# EasyEDA Pro project ProPrj_STM32_无人机_2026-10-21.epro, board PCB1
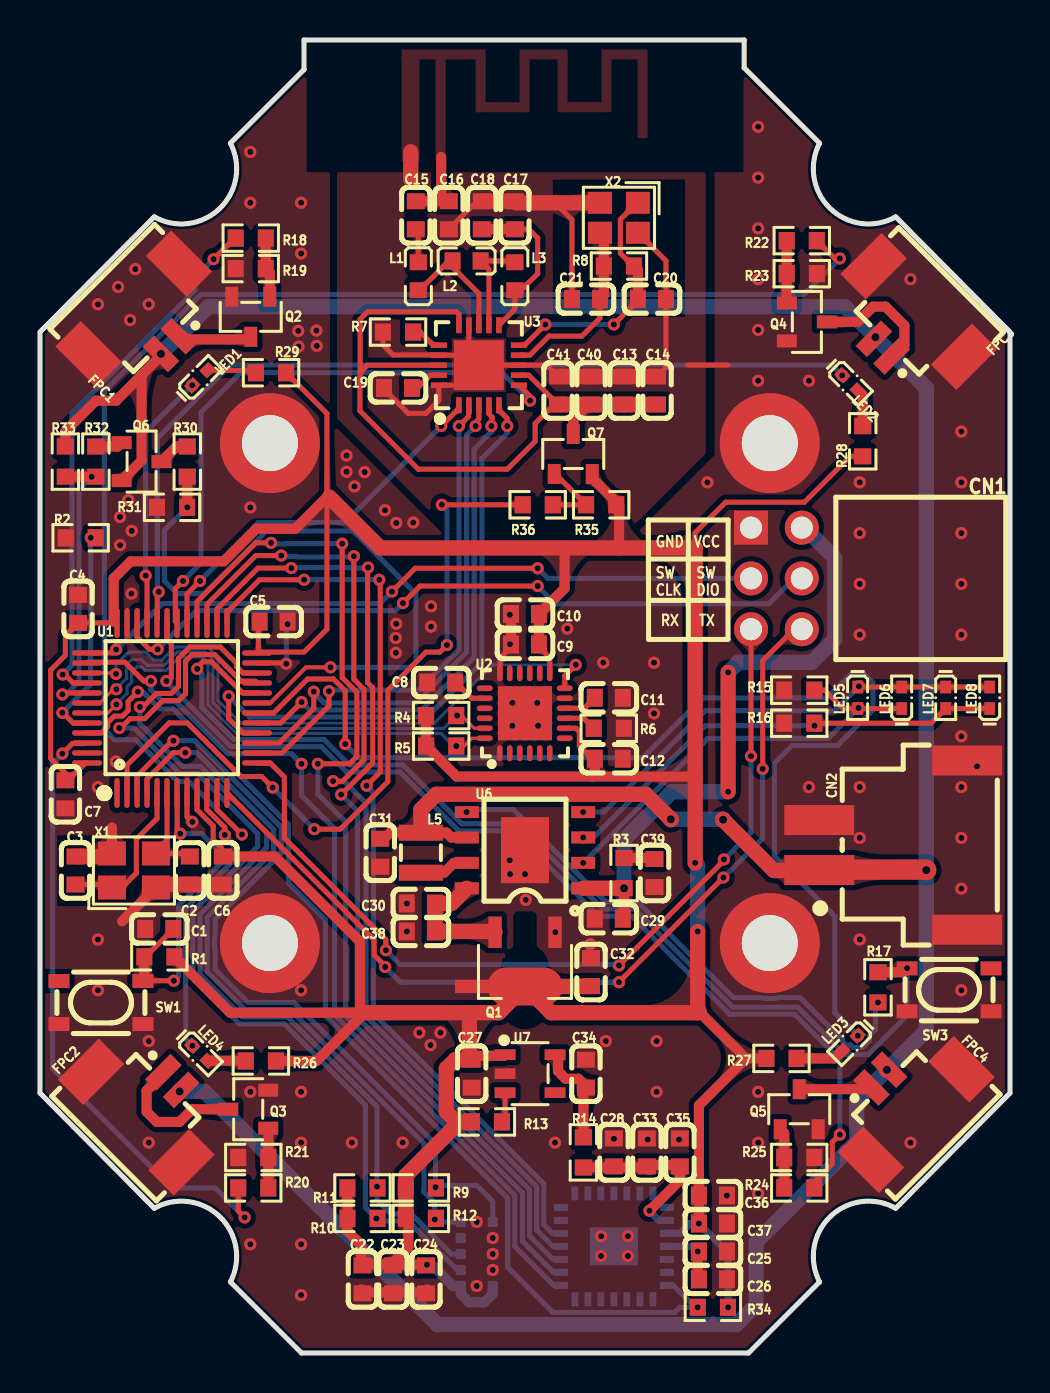
[diagram p12: board, top side]
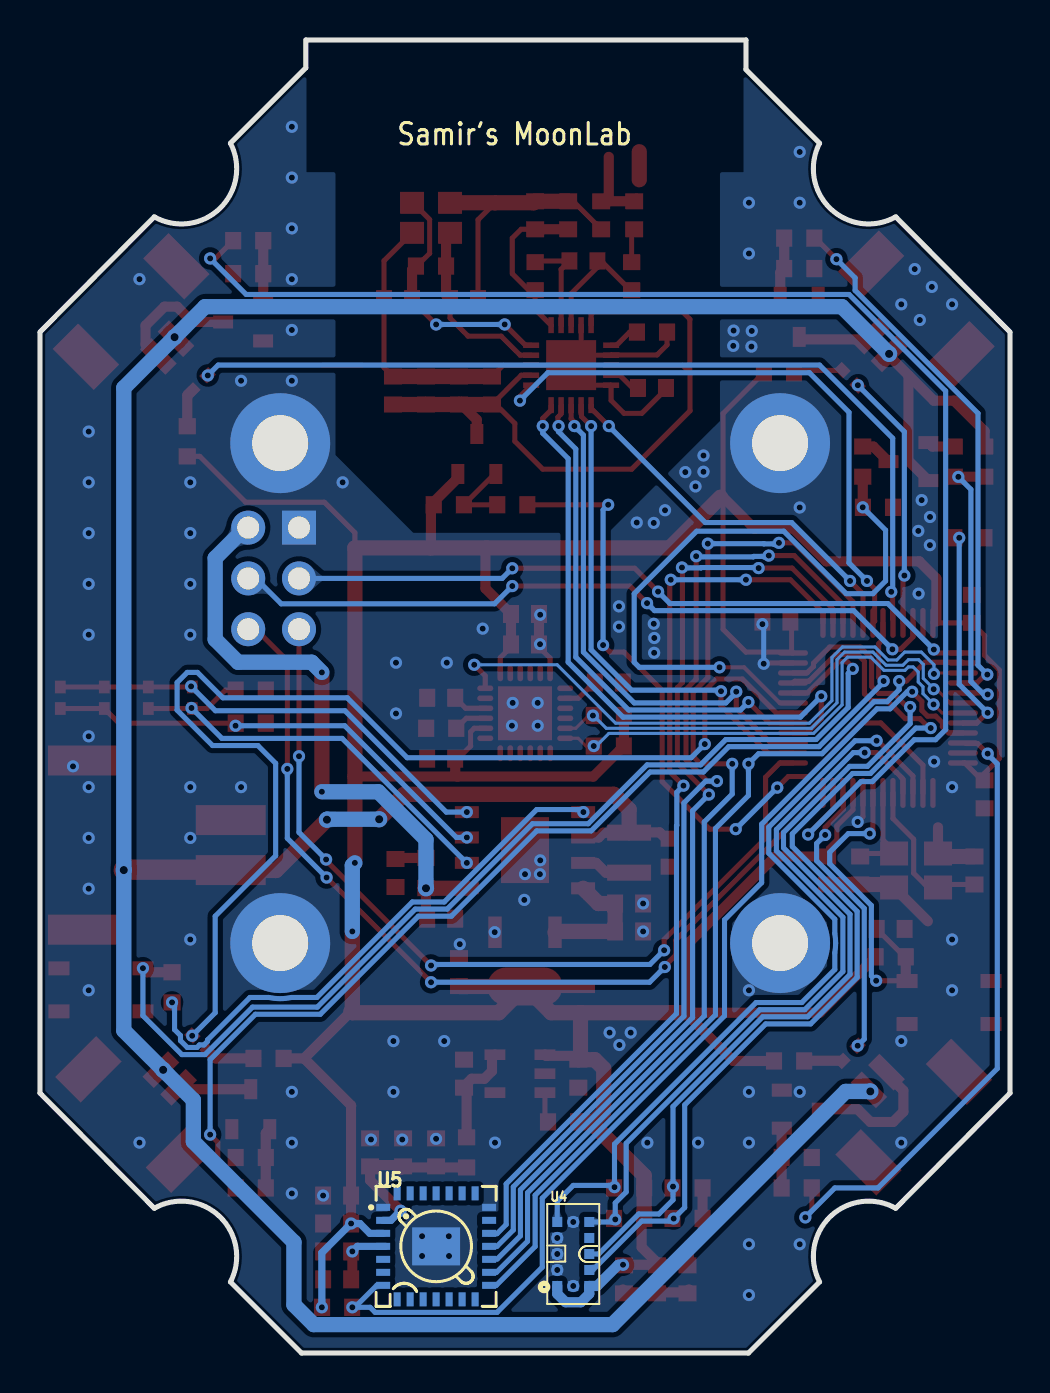
[diagram p13: board, bottom side, seen from below]

Outline 48.51 x 65.66 mm; copper layers: Top Layer, Bottom Layer. Coordinates in mm from the lower left corner of the outline.
Outline path: 0,51.05 5.72,56.81 arc(8.99,57.24) 9.53,60.5 13.21,64.18 13.21,65.66 35.22,65.66 35.22,64.27 38.99,60.5 arc(39.52,57.24) 42.8,56.81 48.51,51.05 ; 0,51 0,13 5.72,7.24 arc(8.99,6.82) 9.53,3.56 13.08,0 35.43,0 38.99,3.56 arc(39.52,6.82) 42.8,7.24 48.51,13 48.51,51
Stack: Top Layer 0.035mm / Dielectric1 1.51mm FR4 er 4.5 / Bottom Layer 0.035mm

## Design rules (mm)
spacing copperThickness1oz (default): track to track 0.102, other pairs 0.152 to 0.3
spacing copperThickness2oz: track to track 0.203, other pairs 0.152 to 0.3
track width copperThickness1oz (default): min 0.127, default 0.254, max 2.54
track width copperThickness2oz: min 0.203, default 0.254, max 2.54
differential pair differentialPair (default): width min 0.127, default 0.254, max 2.54; gap min 0.152, default 0.152
net GND uses copperRegion

## Placement (name value [footprint] x y rotation side)
C1  100nF  [C0603]  5.97 21.21 0 top
C2  12pF  [C0603]  7.49 24.13 90 top
C3  12pF  [C0603]  1.78 24.13 90 top
C4  100nF  [C0603]  1.91 37.21 270 top
C5  100nF  [C0603]  11.68 36.57 180 top
C6  100nF  [C0603]  9.14 24.13 90 top
C7  100nF  [C0603]  1.27 27.94 90 top
C8  2.2nF  [C0603]  20.07 33.53 180 top
C9  100nF  [C0603]  24.26 35.43 180 top
C10  2.2uF  [C0603]  24.26 36.96 180 top
C11  100nF  [C0603]  28.45 32.77 180 top
C12  10nF  [C0603]  28.45 29.72 0 top
C13  100nF  [C0603]  29.21 48.13 270 top
C14  10uF  [C0603]  30.86 48.13 270 top
C15  1.5pF  [C0603]  18.8 56.89 90 top
C16  1pF  [C0603]  20.45 56.89 90 top
C17  4.7pF  [C0603]  23.75 56.89 270 top
C18  2.2nF  [C0603]  22.1 56.89 270 top
C19  33nF  [C0603]  17.91 48.26 180 top
C20  22pF  [C0603]  30.61 52.7 0 top
C21  22pF  [C0603]  27.31 52.7 0 top
C22  4.7uF  [C0603]  16.13 3.68 90 top
C23  100nF  [C0603]  17.65 3.68 90 top
C24  1pF  [C0603]  19.3 3.68 90 top
C25  100nF  [C0603]  33.66 5.08 180 top
C26  4.7uF  [C0603]  33.66 3.68 180 top
C27  1uF  [C0603]  21.59 13.97 90 top
C28  22uF  [C0603]  28.7 10.03 90 top
C29  10uF  [C0603]  28.45 21.72 0 top
C30  10uF  [C0603]  19.05 22.48 180 top
C31  10uF  [C0603]  17.02 25.02 270 top
C32  10uF  [C0603]  27.56 19.05 90 top
C33  22uF  [C0603]  30.35 10.03 90 top
C34  1uF  [C0603]  27.31 13.97 270 top
C35  100nF  [C0603]  32 10.03 90 top
C36  10uF  [C0603]  33.66 7.87 0 top
C37  100nF  [C0603]  33.66 6.48 180 top
C38  22uF  [C0603]  19.05 21.08 0 top
C39  10uF  [C0603]  30.73 24 90 top
C40  10nF  [C0603]  27.56 48.13 270 top
C41  1nF  [C0603]  25.91 48.13 270 top
CN1  IPCP254F06PB28R  [HDR-TH_6P-P2.54-H-F-R2-C3-S2.54-1]  36.83 38.73 90 top
CN2  ZX-XH2.54-2PWT  [CONN-SMD_2P-P2.54_MEGASTAR_ZX-XH2.54-2PWT]  42.67 25.4 90 top
FPC1  1.25-2PWB  [CONN-SMD_2P-P1.25_DEALON_1.25-2PWB]  5.59 51.31 225 top
FPC2  1.25-2PWB  [CONN-SMD_2P-P1.25_DEALON_1.25-2PWB]  5.72 12.7 315 top
FPC3  1.25-2PWB  [CONN-SMD_2P-P1.25_DEALON_1.25-2PWB]  43.05 51.18 135 top
FPC4  1.25-2PWB  [CONN-SMD_2P-P1.25_DEALON_1.25-2PWB]  42.93 12.83 45 top
L1  3.9nH  [L0603]  18.92 53.85 90 top
L2  8.2nH  [L0603]  21.34 54.61 180 top
L3  2.7nH  [L0603]  23.75 53.85 90 top
L5  2.2uH  [IND-SMD_L2.5-W2.0_MHCHL2520]  19.05 25.02 90 top
LED1  XL-1005UYC  [LED0402-FD_YELLOW]  8 48.77 225 top
LED2  XL-1005UYC  [LED0402-FD_YELLOW]  40.51 48.51 135 top
LED3  XL-1005UYC  [LED0402-FD_YELLOW]  40.51 15.49 45 top
LED4  XL-1005UYC  [LED0402-FD_YELLOW]  8 14.98 135 top
LED5  XL-1005UYC  [LED0402-FD_YELLOW]  40.89 32.77 90 top
LED6  XL-1005UYC  [LED0402-FD_YELLOW]  43.1 32.77 270 top
LED7  XL-1005UYC  [LED0402-FD_YELLOW]  45.3 32.77 90 top
LED8  XL-1005UYC  [LED0402-FD_YELLOW]  47.5 32.77 270 top
NOREF  -  [Pad_e325]  11.5 20.5 0 top
NOREF#2  -  [Pad_e976]  18.54 59.69 90 top
NOREF#3  -  [Pad_e977]  20.03 59.69 90 top
NOREF#4  -  [Pad_e328]  36.5 20.5 0 top
NOREF#5  -  [Pad_e327]  36.5 45.5 0 top
NOREF#6  -  [Pad_e326]  11.5 45.5 0 top
Q1  AMS1117-3.3V  [SOT-89-3_L4.5-W2.5-P1.50-LS4.2-BR]  24.26 19.68 90 top
Q2  AO3400A  [SOT-23-3_L2.9-W1.3-P1.90-LS2.4-BR]  10.54 51.81 90 top
Q3  AO3400A  [SOT-23-3_L2.9-W1.3-P1.90-LS2.4-BR]  10.41 12.19 0 top
Q4  AO3400A  [SOT-23-3_L2.9-W1.3-P1.90-LS2.4-BR]  38.35 51.56 180 top
Q5  AO3400A  [SOT-23-3_L2.9-W1.3-P1.90-LS2.4-BR]  37.97 12.19 270 top
Q6  SI2301A  [SOT-23-3_L2.9-W1.3-P1.90-LS2.4-BR]  5.08 44.58 180 top
Q7  SI2301A  [SOT-23-3_L2.9-W1.3-P1.90-LS2.4-BR]  26.67 44.96 270 top
R1  10KΩ  [R0603]  5.97 19.81 0 top
R2  10KΩ  [R0603]  2.03 40.77 180 top
R3  2Ω  [R0603]  29.21 24 90 top
R4  10KΩ  [R0603]  20.07 31.88 180 top
R5  10KΩ  [R0603]  20.07 30.35 180 top
R6  10KΩ  [R0603]  28.45 31.24 180 top
R7  22KΩ  [R0603]  17.91 51.05 180 top
R8  1MΩ  [R0603]  28.96 54.35 180 top
R9  10K  [R0603]  19.05 8.25 0 top
R10  10K  [R0603]  16.13 6.73 0 top
R11  10K  [R0603]  16.13 8.25 0 top
R12  10K  [R0603]  19.05 6.73 0 top
R13  1KΩ  [R0603]  22.35 11.56 0 top
R14  3Ω  [R0603]  27.18 10.03 270 top
R15  100KΩ  [R0603]  37.97 33.15 0 top
R16  100KΩ  [R0603]  37.97 31.49 0 top
R17  10KΩ  [R0603]  41.91 18.29 90 top
R18  1KΩ  [R0603]  10.54 55.75 0 top
R19  10KΩ  [R0603]  10.54 54.23 0 top
R20  1KΩ  [R0603]  10.67 8.25 0 top
R21  10KΩ  [R0603]  10.67 9.78 0 top
R22  1KΩ  [R0603]  38.1 55.62 180 top
R23  10KΩ  [R0603]  38.1 53.97 180 top
R24  1KΩ  [R0603]  37.97 8.25 180 top
R25  10KΩ  [R0603]  37.97 9.78 180 top
R26  10K  [R0603]  11.05 14.6 0 top
R27  10K  [R0603]  37.08 14.73 180 top
R28  10K  [R0603]  41.15 45.59 270 top
R29  10K  [R0603]  11.56 49.02 0 top
R30  100KΩ  [R0603]  7.37 44.58 90 top
R31  100KΩ  [R0603]  6.6 42.29 0 top
R32  1KΩ  [R0603]  2.79 44.58 270 top
R33  100KΩ  [R0603]  1.27 44.58 270 top
R34  10K  [R0603]  33.66 2.28 180 top
R35  10K  [R0603]  28.07 42.42 0 top
R36  1K  [R0603]  24.89 42.42 0 top
SW1  SKRPACE010  [KEY-SMD_4P-L4.2-W3.2-P2.20-LS4.6]  3.05 17.52 0 top
SW3  SKRPACE010  [KEY-SMD_4P-L4.2-W3.2-P2.20-LS4.6]  45.47 18.16 0 top
U1  STM32F103C8T6  [LQFP-48_L7.0-W7.0-P0.50-LS9.0-BL]  6.6 32.26 0 top
U2  MPU-6050  [QFN-24_L4.0-W4.0-P0.50-BL-EP2.7]  24.24 31.99 0 top
U3  Si24R1  [QFN-20_L4.0-W4.0-P0.50-BL-EP]  21.95 49.4 0 top
U4  VL53L1CXV0FY/1  [OPTO-SMD_VL53L1CXV0FY-1]  21.84 4.95 270 bottom
U5  PMW3901MB-TXQT  [COB-28_L6.0-W6.0-P0.65-TL-EP]  28.7 5.33 180 bottom
U6  IP5305T  [ESOP-8_L4.9-W3.9-P1.27-LS6.0-BL-EP]  24.26 25.14 90 top
U7  XC6204B182MR  [SOT-23-5_L3.0-W1.5-P0.95-LS2.8-BL]  24.51 13.97 270 top
X1  8MHz  [CRYSTAL-SMD_4P-L3.2-W2.5-BL]  4.7 24.13 0 top
X2  16MHz  [CRYSTAL-SMD_4P-L2.5-W2.0-BL-2]  28.96 56.77 180 top

## Footprints (pads in the part's own frame, mm; a bottom-side part is the same pattern mirrored in y, then rotated)
C0603
  rect 0.8x0.9 smd: 1(-0.7,0) 2(0.7,0)
COB-28_L6.0-W6.0-P0.65-TL-EP
  rect 0.7x0.35 smd: 1(-2.65,1.95) 2(-2.65,1.3) 3(-2.65,0.65) 4(-2.65,0) 5(-2.65,-0.65) 6(-2.65,-1.3) 7(-2.65,-1.95) 15(2.65,-1.95) 16(2.65,-1.3) 17(2.65,-0.65) 18(2.65,0) 19(2.65,0.65) 20(2.65,1.3) 21(2.65,1.95)
  rect 0.35x0.7 smd: 8(-1.95,-2.65) 9(-1.3,-2.65) 10(-0.65,-2.65) 11(0,-2.65) 12(0.65,-2.65) 13(1.3,-2.65) 14(1.95,-2.65) 22(1.95,2.65) 23(1.3,2.65) 24(0.65,2.65) 25(0,2.65) 26(-0.65,2.65) 27(-1.3,2.65) 28(-1.95,2.65)
  rect 2.4x1.9 smd: 29(0,0)
CONN-SMD_2P-P1.25_DEALON_1.25-2PWB
  rect 0.8x1.8 smd: 1(-0.625,1.275) 2(0.625,1.275)
  rect 1.8x2.9 smd: 3(-3.2,-1.275) 4(3.2,-1.275)
CONN-SMD_2P-P2.54_MEGASTAR_ZX-XH2.54-2PWT
  rect 1.5x3.5 smd: 1(-1.25,3.7) 2(1.25,3.7) 3(-4.23,-3.7) 4(4.23,-3.7)
CRYSTAL-SMD_4P-L2.5-W2.0-BL-2
  rect 1.2x1.1 smd: 1(-0.95,-0.75) 2(0.95,-0.75) 3(0.95,0.75) 4(-0.95,0.75)
CRYSTAL-SMD_4P-L3.2-W2.5-BL
  rect 1.4x1.2 smd: 1(-1.1,-0.85) 2(1.1,-0.85) 3(1.1,0.85) 4(-1.1,0.85)
ESOP-8_L4.9-W3.9-P1.27-LS6.0-BL-EP
  rect 0.6x1.2 smd: 1(-1.905,-2.909) 2(-0.635,-2.909) 3(0.635,-2.909) 4(1.905,-2.909) 5(1.905,2.909) 6(0.635,2.909) 7(-0.635,2.909) 8(-1.905,2.909)
  rect 3.3x2.4 smd: 9(0,0)
HDR-TH_6P-P2.54-H-F-R2-C3-S2.54-1
  rect 1.7x1.7 hole 1.1: 1(2.54,1.27)
  round 1.7 hole 1.1: 2(2.54,-1.27) 3(0,1.27) 4(0,-1.27) 5(-2.54,1.27) 6(-2.54,-1.27)
IND-SMD_L2.5-W2.0_MHCHL2520
  rect 0.8x2.2 smd: 1(-1,0) 2(1,0)
KEY-SMD_4P-L4.2-W3.2-P2.20-LS4.6
  rect 1.05x0.7 smd: 1(-2.1,1.075) 2(2.1,1.075) 3(-2.1,-1.075) 4(2.1,-1.075)
L0603
  rect 0.8x0.864 smd: 1(-0.7,0) 2(0.7,0)
LED0402-FD_YELLOW
  rect 0.636x0.54 smd: 1(-0.538,0) 2(0.538,0)
LQFP-48_L7.0-W7.0-P0.50-LS9.0-BL
  oval 0.27x1.5 smd: 1(-2.75,-4.25) 2(-2.25,-4.25) 3(-1.75,-4.25) 4(-1.25,-4.25) 5(-0.75,-4.25) 6(-0.25,-4.25) 7(0.25,-4.25) 8(0.75,-4.25) 9(1.25,-4.25) 10(1.75,-4.25) 11(2.25,-4.25) 12(2.75,-4.25) 25(2.75,4.25) 26(2.25,4.25) 27(1.75,4.25) 28(1.25,4.25) 29(0.75,4.25) 30(0.25,4.25) 31(-0.25,4.25) 32(-0.75,4.25) 33(-1.25,4.25) 34(-1.75,4.25) 35(-2.25,4.25) 36(-2.75,4.25)
  oval 1.5x0.27 smd: 13(4.25,-2.75) 14(4.25,-2.25) 15(4.25,-1.75) 16(4.25,-1.25) 17(4.25,-0.75) 18(4.25,-0.25) 19(4.25,0.25) 20(4.25,0.75) 21(4.25,1.25) 22(4.25,1.75) 23(4.25,2.25) 24(4.25,2.75) 37(-4.25,2.75) 38(-4.25,2.25) 39(-4.25,1.75) 40(-4.25,1.25) 41(-4.25,0.75) 42(-4.25,0.25) 43(-4.25,-0.25) 44(-4.25,-0.75) 45(-4.25,-1.25) 46(-4.25,-1.75) 47(-4.25,-2.25) 48(-4.25,-2.75)
OPTO-SMD_VL53L1CXV0FY-1
  rect 0.5x0.5 smd: 1(1.6,-0.8) 2(0.8,-0.8) 3(0,-0.8) 4(-0.8,-0.8) 5(-1.6,-0.8) 6(-1.6,0) 7(-1.6,0.8) 8(-0.8,0.8) 9(0,0.8) 10(0.8,0.8) 11(1.6,0.8) 12(1.6,0)
Pad_e325
  round 5 hole 2.8: 1(0,0)
Pad_e326
  round 5 hole 2.8: 1(0,0)
Pad_e327
  round 5 hole 2.8: 1(0,0)
Pad_e328
  round 5 hole 2.8: 1(0,0)
Pad_e976
  rect 0.2x0.2 smd: 2(0,0)
Pad_e977
  rect 0.2x0.2 smd: 1(0,0)
QFN-20_L4.0-W4.0-P0.50-BL-EP
  rect 0.28x0.8 smd: 1(-1,-2) 2(-0.5,-2) 3(0,-2) 4(0.5,-2) 5(1,-2) 11(1,2) 12(0.5,2) 13(0,2) 14(-0.5,2) 15(-1,2)
  rect 0.8x0.28 smd: 6(2,-1) 7(2,-0.5) 8(2,0) 9(2,0.5) 10(2,1) 16(-2,1) 17(-2,0.5) 18(-2,0) 19(-2,-0.5) 20(-2,-1)
  rect 2.5x2.5 smd: 21(0,0)
QFN-24_L4.0-W4.0-P0.50-BL-EP2.7
  oval 0.28x0.8 smd: 1(-1.25,-2) 2(-0.75,-2) 3(-0.25,-2) 4(0.25,-2) 5(0.75,-2) 6(1.25,-2) 13(1.25,2) 14(0.75,2) 15(0.25,2) 16(-0.25,2) 17(-0.75,2) 18(-1.242,2)
  oval 0.8x0.28 smd: 7(2,-1.25) 8(2,-0.75) 9(2,-0.25) 10(2,0.25) 11(2,0.75) 12(2,1.25) 19(-2,1.25) 20(-2,0.75) 21(-2,0.25) 22(-2,-0.25) 23(-2,-0.75) 24(-2,-1.25)
  rect 2.7x2.7 smd: 25(0.013,0)
R0603
  rect 0.806x0.864 smd: 1(-0.753,0) 2(0.753,0)
SOT-23-3_L2.9-W1.3-P1.90-LS2.4-BR
  rect 1x0.65 smd: 1(1,-0.95) 2(1,0.95) 3(-1,0)
SOT-23-5_L3.0-W1.5-P0.95-LS2.8-BL
  rect 0.532x1.045 smd: 1(-0.95,-1.25) 2(0,-1.25) 3(0.95,-1.25) 4(0.95,1.25) 5(-0.95,1.25)
SOT-89-3_L4.5-W2.5-P1.50-LS4.2-BR
  rect 1.575x0.672 smd: 1(1.356,-1.5) 3(1.356,1.5)
  custom 1.9x5.377 smd: 2(-1.356,0)

## Nets
As in the schematic, except:
GND: C1.1 C2.1 C3.2 C4.1 C5.1 C6.1 C7.1 C8.2 C9.2 C10.2 C11.1 C12.2 C13.1 C14.1 C16.1 C17.1 C18.1 C19.2 C20.2 C21.1 C22.1 C23.1 C24.1 C25.1 C26.1 C27.1 C28.2 C29.1 C30.2 C31.2 C32.2 C33.2 C34.1 C35.2 C36.2 C37.1 C38.1 C39.1 C40.1 C41.1 CN1.1 CN2.2 CN2.3 CN2.4 FPC1.3 FPC1.4 FPC2.3 FPC2.4 FPC3.3 FPC3.4 FPC4.3 FPC4.4 NOREF.1 NOREF#2.2 NOREF#4.1 NOREF#5.1 NOREF#6.1 Q1.1 Q2.2 Q3.2 Q4.2 Q5.2 R2.2 R6.1 R7.2 R15.1 R16.1 R19.1 R21.1 R23.1 R25.1 R31.1 SW1.3 SW1.4 SW3.3 SW3.4 U1.8 U1.23 U1.35 U1.47 U2.1 U2.11 U2.18 U2.25 U3.8 U3.14 U3.17 U3.20 U3.21 U4.2 U4.3 U4.4 U4.6 U4.12 U5.1 U5.21 U5.29 U6.9 U7.2 X1.2 X1.4 X2.2 X2.4
AT1: C15.2 C16.2 NOREF#3.1

Pads without a net: SW1 1; SW3 2; U1 1; U2 2 3 4 5 6 7 14 15 16 17 19 21 22; U4 8; U5 5 6 8 9 10 11 12 13 14 20 22 23 24 25 26 27 28; U7 4

## Via types
v1: diameter 0.61, hole 0.305, Top Layer to Bottom Layer, 224 vias
v2: diameter 0.813, hole 0.406, Top Layer to Bottom Layer, 8 vias

## Routing (per net, layer and track width the routed paths; a pad name or vN(x,y) marks a point on that pad's centre or on a via; arc(x,y) is an arc through that point)
1V8: length 5.2
  Top Layer w0.508: U7.5 25.91,14.77 25.91,14.1 26.29,13.71 26.92,13.71 27.31,13.33 C34.2 27.18,13.14 R14.1
3V3: length 233.1
  Top Layer w0.254: 10.92,35.05 13.21,35.05 14.35,36.19 14.35,42.67 ; 10.92,35.05 10.92,36.51 ; 10.92,35.05 10.88,35.01 U1.24 ; U1.36 3.75,36.51 3.75,36.51 C4.2 1.27,35.88 1.27,34.89 0.53,34.15 0.53,29.73 1.27,28.99 C7.2 ; 9.08,24.83 9.08,25.25 8.66,25.66 8.66,26.36 7.85,27.17 U1.9 ; 1.33,28.58 2.27,29.51 U1.48 ; 24.96,35.3 25.49,34.77 U2.13 ; 14.35,42.8 14.35,46.98 R29.2 ; C12.1 27.61,29.72 26.98,30.35 26.98,31.06 26.8,31.24 U2.8 ; R28.2 40.52,44.84 38.23,42.54 34.29,42.54 32.77,41.02 32.77,40.26
  Top Layer w0.508: 17.71,4.58 17.58,4.44 16.06,4.44 16.06,5.41 15.37,6.1 15.37,6.61 ; 17.71,4.58 18.42,5.29 18.42,7.11 ; 17.71,4.58 17.88,4.41 v1(19.35,4.41) ; 24.96,35.3 C10.1 26.24,38.23 26.24,40.2 26.18,40.26 ; R11.1 R10.1 ; C12.1 27.75,28.95 27.62,28.83 ; v1(32.96,6.48) C36.1 32.96,12.38 35.31,14.73 ; 28.96,40.26 28.96,42.4 28.83,42.4 R35.2 28.89,42.48 27.62,43.75 Q7.2 ; 35.31,14.73 R27.2 ; 35.31,14.73 32.96,17.08 ; 3.68,36.57 3.68,38.73 4.54,39.59 9.19,39.59 10.82,41.22 12.78,41.22 14.35,42.8 14.35,42.67 14.48,42.8 ; C27.2 21.78,14.86 23.2,14.86 U7.1 ; 27.62,28.83 20.84,28.83 R5.2 R4.2 ; 27.62,28.83 32.77,28.83 ; C6.2 11.75,24.83 16,20.57 16,17.28 16.26,17.03 ; R26.2 13.83,14.6 16.25,17.02 9.52,17.02 R1.2
  Top Layer w0.762: 21.48,17.02 22.95,17.02 24.26,18.33 ; 21.48,17.02 21.48,14.78 C27.2 20.77,14.67 20.32,14.22 20.32,12.06 20.83,11.56 20.98,11.56 ; 21.48,17.02 16.25,17.02 ; 14.48,42.8 17.02,40.26 32.77,40.26 v1(32.77,24.51) ; v1(32.89,21.08) 32.89,17.14 32.96,17.08 32.89,17.02 25.57,17.02 24.26,18.33 ; 20.98,11.56 18.3,8.87 R9.1 18.3,7.11 ; 20.98,11.56 R13.1 ; C32.1 27.54,18.33 24.26,18.33
  Bottom Layer w0.355: U5.3 32.02,5.98 32.51,6.48 v1(32.96,6.48) 34.42,5.01 v1(34.42,2.28)
  Bottom Layer w0.508: U4.1 22.64,2.96 22.22,2.54 21.46,2.54 21.04,2.96 U4.11 20.65,3.35 19.59,4.41 v1(19.35,4.41)
  Bottom Layer w0.762: v1(32.77,24.51) 32.89,24.38 v1(32.89,21.08)
+5V: length 6.3
  Top Layer w0.762: Q1.3 22.72,21.08 C38.2 C30.1 20.59,22.48 U6.8
GND: length 67.4
  Top Layer w0.254: U1.23 12.29,34.51 12.32,34.48 ; 32.38,49.4 34.42,49.4 ; X2.4 31.31,54.62 C20.2 31.31,49.28 C14.1 ; R7.2 17.15,50.41 17.65,49.91 19.94,49.91 U3.17 21.45,49.9 U3.14 ; 25.75,57.52 26.6,56.67 26.6,52.7 ; C41.1 25.34,49.4 U3.8 U3.21 20.95,48.4 U3.20 19.95,47.64 19.3,46.99 18.41,46.99 17.21,48.2 C19.2 ; 23.56,35.3 23,34.75 U2.18 ; C5.1 12.32,36.51 12.32,36.45 ; C16.1 21.85,57.59 ; v1(7.62,26.56) 7.35,26.82 U1.8
  Top Layer w0.508: 19.36,3.18 19.21,3.03 16.21,3.03 16.06,3.18 ; 5.8,23.28 4.11,21.59 ; X1.4 3.6,26.29 ; 23.56,36.96 23.56,35.3
  Top Layer w0.762: C41.1 C40.1 C13.1 C14.1 ; C6.1 C2.1 5.95,23.43 5.8,23.28 ; X2.2 23.83,57.52 C17.1 C18.1 ; C3.2 3.07,24.83 3.22,24.98 ; 18.54,58.67 18.54,60.07
  Bottom Layer w0.254: 12.32,34.48 12.32,36.45
  vias: v1(2.9,52.44) v1(2.9,28.3) v1(2.9,20.68) v1(2.9,18.14) v1(3.8,29.57) v1(3.91,53.31) v1(4,41.81) v1(4.01,40.4) v1(4.42,42.65) v1(4.51,51.66) v1(4.59,41.11) v1(4.57,37.97) v1(4.77,54.2) v1(5.44,52.44) v1(5.44,15.6) v1(5.44,10.52) v1(10.52,60.06) v1(10.52,57.52) v1(10.52,42.28) v1(10.52,13.06) v1(10.52,5.44) v1(12.32,34.47) v1(12.38,36.45) v1(12.91,51.11) v1(12.93,50.33) v1(13.06,57.52) v1(13.06,54.98) v1(13.06,18.14) v1(13.06,13.06) v1(13.06,10.52) v1(13.06,5.44) v1(13.06,2.9) v1(13.82,51.13) v1(13.84,50.36) v1(15.33,44.88) v1(15.33,44.07) v1(15.6,10.52) v1(15.73,43.33) v1(16.24,44.05) v1(17.25,42.14) v1(17.82,41.51) v1(17.82,36.47) v1(17.79,35.76) v1(17.8,35.01) v1(18.14,10.52) v1(18.35,22.48) v1(18.35,21.08) v1(18.67,41.53) v1(18.97,16.02) v1(19.54,15.4) v1(19.56,37.34) v1(19.56,36.32) v1(20.03,16.02) v1(21.84,6.55) v1(21.84,3.35) v1(22.64,5.75) v1(22.64,4.95) v1(22.64,4.15) v1(23.5,36.92) v1(23.51,35.44) v1(23.5,24.64) v1(23.51,23.94) v1(23.62,32.51) v1(23.62,31.37) v1(24.26,23.94) v1(24.29,22.66) v1(24.87,32.51) v1(24.91,31.37) v1(25.77,21.05) v1(25.76,10.52) v1(26.37,36.22) v1(27.52,20.44) v1(28.07,5.84) v1(28.06,4.85) v1(28.17,34.52) v1(28.3,15.6) v1(28.7,10.71) v1(29.41,5.84) v1(29.41,4.85) v1(30.4,10.68) v1(30.71,34.52) v1(30.71,31.98) v1(30.84,15.6) v1(30.84,13.06) v1(31.96,10.68) v1(33.38,43.54) v1(34.35,7.87) v1(35.92,61.32) v1(35.92,58.78) v1(35.92,56.24) v1(35.92,53.7) v1(35.92,51.16) v1(35.92,48.62) v1(35.92,13.06) v1(35.92,10.52) v1(35.92,7.98) v1(38.46,48.62) v1(38.46,28.3) v1(41,43.54) v1(41,41) v1(41,38.46) v1(41,35.92) v1(41,28.3) v1(41,25.76) v1(41,20.68) v1(43.54,53.7) v1(43.54,10.52) v1(46.08,46.08) v1(46.08,43.54) v1(46.08,41) v1(46.08,38.46) v1(46.08,35.92) v1(46.08,30.84) v1(46.08,28.3) v1(46.08,25.76) v1(46.08,23.22) v1(46.08,18.14) v1(46.86,29.34)
VBAT: length 170.2
  Top Layer w0.508: C31.1 17.21,25.72 17.53,26.03 19.03,26.03 L5.2 20.34,26.02 20.57,25.78 U6.6 ; Q6.2 5.08,44.63 5.08,48.89 ; R33.1 1.27,46.1 2.79,47.62 3.81,47.62 5.08,48.89 ; v2(6.05,49.96) 6.05,49.86 5.08,48.89
  Top Layer w0.762: L5.2 19.05,27.18 19.81,27.94 30.3,27.94 v2(31.55,26.69) ; 38.95,24.13 36.7,24.13 v2(34.16,26.67)
  Top Layer w1.016: v2(44.32,24.15) 44.3,24.17 39,24.17 CN2.1
  Bottom Layer w0.762: v2(6.05,49.96) 8.41,52.32 40.26,52.32 v2(41.78,50.8) 44.32,48.26 v2(44.32,24.15) 44.32,16.13 v2(42.35,14.16) 40.84,12.65 40.84,10.57 35.81,5.54 35.81,2.41 34.82,1.42 19.88,1.42 8.22,13.08 v2(6.98,13.08) ; v2(31.55,26.69) 34.14,26.69 v2(34.16,26.67)
VCC: length 30.9
  Top Layer w0.508: v2(29.21,23.24) 29.21,21.91 29.02,21.72
  Top Layer w0.762: v2(29.21,23.24) U6.1 ; v1(34.42,34.03) v1(34.42,28.07)
  Bottom Layer w0.762: v2(29.21,23.24) 29.21,25.68 31.6,28.07 v1(34.42,28.07) ; 38.1,41.66 38.1,41.4 39.75,39.75 39.75,35.69 38.61,34.54 34.93,34.54 v1(34.42,34.03)
AT1: length 3.9
  Top Layer w0.508: 20.07,57.72 20.07,59.82 ; 18.87,57.59 C16.2 ; C15.2 18.67,57.72
BAT-ADC-EN: length 14.6
  Top Layer w0.254: v1(1.12,32.93) 1.19,33.01 U1.41
  Top Layer w0.508: v1(2.58,43.81) 2.79,43.81 R32.2 R33.2
  Bottom Layer w0.254: v1(1.12,32.93) 1.31,32.93 1.96,33.58 1.96,43.19 v1(2.58,43.81)
BAT_DET: length 33.3
  Top Layer w0.203: v1(14.53,34.29) 13.3,34.29 11.52,32.51 U1.19
  Top Layer w0.254: v1(7.37,42.29) R31.2
  Top Layer w0.508: R31.2 7.37,42.3 R30.1
  Bottom Layer w0.254: v1(7.37,42.29) 6.22,41.15 6.22,38.61 6.86,37.97 8.19,37.97 11.31,41.1 15.67,41.1 18.8,37.97 18.8,34.54 18.54,34.29 v1(14.53,34.29)
I2C1-SCL: length 25
  Top Layer w0.152: 22.24,31.24 21.72,31.24 21.08,31.88 R4.1 ; U1.42 2.98,32.51 3.67,33.19 v1(3.82,33.19)
  Bottom Layer w0.152: v1(20.86,31.88) 20.83,31.88 20.19,31.24 9.93,31.24 8.65,32.52 8.65,34.67 8.28,35.05 6.86,35.05 6.2,34.39 5.36,34.39 5.08,34.67 4.57,34.67 4.34,34.44 4.34,33.74 3.82,33.22 v1(3.82,33.19)
I2C1-SDA: length 24.9
  Top Layer w0.152: U1.43 3.4,32.01 v1(3.82,32.43) ; U2.24 21.6,30.74 21.21,30.35 20.69,30.35
  Bottom Layer w0.152: v1(3.82,32.43) 3.82,32.45 4.35,32.97 4.35,33.32 4.59,33.56 4.59,34.05 4.84,34.31 5.08,34.31 5.25,34.14 6.3,34.14 6.96,34.8 8.13,34.8 8.4,34.53 8.4,32.41 9.83,30.98 20.06,30.98 20.69,30.35
  vias: v1(20.82,30.35)
I2C2-SCL: length 50
  Top Layer w0.254: U1.21 10.77,33.59 10.06,33.59 8.73,34.92 7.62,34.92 7.28,34.59 7.28,32.96 6.95,32.63 6.14,32.63 5.24,31.72 4.5,31.72 4.03,31.25 v1(3.97,31.25)
  Bottom Layer w0.254: U4.10 20.87,4.15 18.42,6.6 16.95,6.6 v1(16.82,6.72) 16.27,7.27 16.27,12.4 12.22,16.46 9.97,16.46 7.64,18.78 7.64,22.08 10.89,25.33 10.89,25.96 7.87,28.98 6.98,28.98 4.71,31.25 v1(3.97,31.25)
I2C2-SDA: length 48
  Top Layer w0.254: v1(5,32.31) 5.15,32.31 5.83,32.98 6.57,32.98 6.92,33.34 6.92,34.74 7.49,35.3 9.02,35.3 9.82,34.5 9.82,34.34 10.15,34.01 U1.22
  Bottom Layer w0.254: U4.9 20.57,4.95 18.57,6.95 17.56,6.95 16.85,7.66 v1(16.85,8.32) 16.85,12.32 12.36,16.81 10.12,16.81 8,18.93 8,21.94 11.33,25.26 11.33,26.03 8.02,29.34 7.13,29.34 5,31.47 v1(5,32.31)
LED1: length 12.9
  Top Layer w0.254: v1(5.28,38.88) 5.35,38.81 U1.33
  Bottom Layer w0.254: v1(5.28,38.88) 5.28,46.07 v1(7.61,48.4)
LED2: length 45.3
  Top Layer w0.254: 5.87,36.7 5.87,38.03 5.95,38.11
  Bottom Layer w0.254: v1(40.12,48.88) 39.6,49.4 9.53,49.4 5.87,45.74 5.87,37.99 5.94,37.92
  vias: v1(5.94,38.06)
LED3: length 59.4
  Top Layer w0.254: U1.18 11.69,32.01 13.39,33.7 14.68,33.7 15.26,33.12 v1(15.26,30.45)
  Bottom Layer w0.254: v1(15.26,30.45) 15.95,29.77 30.15,29.77 33.15,32.77 39.37,32.77 40.64,34.03 41.15,34.03 41.66,33.53 41.66,32.15 39.88,30.38 37.62,30.38 36.73,29.49 36.73,24.87 39.75,21.84 39.75,17.02 v1(40.9,15.86)
LED4: length 14.3
  Top Layer w0.254: U1.10 8.34,27.99 8.34,27.19 9.25,26.28 v1(9.25,25.91)
  Bottom Layer w0.254: v1(9.25,25.91) 9.67,25.48 9.67,24.62 7.29,22.23 7.29,15.7 v1(7.62,15.37)
LEFT-0: length 26.8
  Top Layer w0.254: U1.40 1.65,33.51 1.23,33.93 v1(1.14,33.93) ; v1(8.68,54.7) 9.74,55.75 R18.1
  Bottom Layer w0.254: v1(1.14,33.93) 1.6,34.39 1.6,46.99 7.75,53.14 7.75,53.76 v1(8.68,54.7)
LEFT-1: length 31.5
  Top Layer w0.254: R20.1 9.91,7.1 v1(10.24,6.78) ; 1.15,29.97 1.15,30 1.63,30.48 2.21,30.48
  Bottom Layer w0.254: 1.15,29.97 0.64,29.46 0.64,14.22 6.6,8.25 8.76,8.25 v1(10.24,6.78)
  vias: v1(1.12,29.97)
MPU_INT: length 31.1
  Top Layer w0.152: U1.39 3.76,34.01 v1(3.8,33.96)
  Top Layer w0.254: v1(26.8,34.42) 26.24,33.86 U2.12
  Bottom Layer w0.152: v1(3.8,33.96) 3.8,34.42 4.44,35.05 5.27,35.05 5.66,34.66 6.1,34.66 6.75,35.3 8.38,35.3 8.91,34.78 8.91,32.62 10.04,31.49 19.72,31.49 22.65,34.42 v1(26.8,34.42)
NRST: length 16.7
  Top Layer w0.254: U1.7 6.86,28 6.86,26.13 v1(7.02,25.97) ; v1(6.69,18.62) 5.16,18.62 ; R1.1 5.27,19.81 C1.2
  Top Layer w0.508: R1.1 5.22,18.67 SW1.2
  Bottom Layer w0.254: v1(7.02,25.97) 8.09,25.97 9.02,25.04 9.02,24.46 6.93,22.38 6.93,18.85 v1(6.69,18.62)
OSC_IN: length 7.7
  Top Layer w0.254: U1.5 5.85,26.73 4.82,25.69 4.82,24 4.25,23.43 C3.1
OSC_OUT: length 4.7
  Top Layer w0.254: U1.6 6.35,25.66 5.92,25.22 5.92,24.98 7.22,24.98 7.37,24.83
PA1: length 69.6
  Top Layer w0.254: v1(10.1,25.93) 8.85,27.17 U1.11 ; R22.1 39.74,54.74 v1(40,54.74)
  Bottom Layer w0.254: v1(40,54.74) 38.2,52.93 8.05,52.93 3.22,48.1 3.22,31.17 3.72,30.67 4.79,30.67 6.88,28.57 7.45,28.57 v1(10.1,25.93)
PA2: length 45.8
  Top Layer w0.254: U1.12 16.71,20.65 16.71,19.9 17.26,19.35 v1(17.26,19.3) ; v1(34.18,23.78) 28.96,18.55 v1(28.96,18.54) ; 38.1,36.57 36.14,34.62 v1(36.14,29.21)
  Bottom Layer w0.254: v1(17.26,19.3) 18.03,18.54 v1(28.96,18.54) ; v1(34.18,23.78) 36.14,25.74 v1(36.14,29.21)
PA3: length 44.3
  Top Layer w0.254: U1.13 11.51,29.51 12.22,28.8 12.22,25.75 17.3,20.67 v1(17.3,20.14) ; v1(28.96,19.38) 34.21,24.63 v1(34.21,24.68) ; 35.56,36.57 v1(35.56,29.84)
  Bottom Layer w0.254: v1(35.56,29.84) 35.56,26.03 v1(34.21,24.68) ; v1(17.3,20.14) 18.01,19.43 28.91,19.43 v1(28.96,19.38)
PA4: length 25.1
  Top Layer w0.254: v1(14.45,33.09) 14.45,32.36 12.1,30.01 U1.14 ; v1(20.95,46.35) 21.43,46.83 21.43,46.95 21.45,46.96 U3.2
  Bottom Layer w0.254: v1(14.45,33.09) 14.51,33.15 18.93,33.15 20.95,35.17 v1(20.95,46.35)
PA5: length 25.7
  Top Layer w0.254: v1(13.69,33.07) 13.69,32.23 11.96,30.5 10.86,30.5 U1.15 ; 21.84,46.61 21.95,46.71 U3.3
  Bottom Layer w0.254: v1(21.79,46.35) 21.34,45.9 21.34,35.05 18.79,32.51 14.21,32.51 13.69,33.03 v1(13.69,33.07)
PA6: length 30.6
  Top Layer w0.254: v1(23.37,46.35) 23.37,46.73 22.95,47.15 U3.5 ; v1(9.44,32.84) 9.44,31.72 10.15,31.01 U1.16
  Bottom Layer w0.254: v1(23.37,46.35) 23.37,45.99 22.1,44.72 22.1,34.54 19.35,31.8 10.49,31.8 v1(9.44,32.84)
PA7: length 25.6
  Top Layer w0.254: v1(13.08,32.55) 12.04,31.51 U1.17 ; v1(22.58,46.35) 22.61,46.39 22.61,46.8 22.45,46.96 U3.4
  Bottom Layer w0.254: v1(13.08,32.55) 13.48,32.15 19.07,32.15 21.72,34.8 21.72,45.21 22.58,46.07 v1(22.58,46.35)
PA8: length 19.1
  Top Layer w0.254: U1.29 7.35,37.96 v1(8,38.61) ; U3.1 20.95,47.24 v1(20.07,46.35)
  Bottom Layer w0.254: v1(20.07,46.35) 15.24,41.53 10.92,41.53 v1(8,38.61)
PA9: length 30
  Top Layer w0.254: v1(24.51,47.62) 24.51,47.84 U3.6 ; U1.30 6.77,36.59 6.77,38.22 v1(7.15,38.61)
  Bottom Layer w0.254: v1(24.51,47.62) 23.11,49.02 10.03,49.02 8.05,47.04 8.05,39.51 v1(7.15,38.61)
PA10: length 51.6
  Top Layer w0.254: R24.1 38.73,8.55 39.62,9.45 39.62,10.54 v1(40,10.92) ; v1(6.32,33.6) 6.39,33.6 6.57,33.78 6.57,35.47 6.35,35.68 U1.31
  Bottom Layer w0.254: v1(40,10.92) 40,14.67 37.74,16.94 34.49,16.94 29.59,21.84 27.94,21.84 23.67,26.11 20.95,26.11 18,29.06 15.33,29.06 14.06,30.32 9.55,30.32 6.32,33.55 v1(6.32,33.6)
PA13: length 36.6
  Top Layer w0.254: v1(18.15,37.5) 19.01,38.35 v1(24.89,38.35) ; U1.34 4.85,35.81 5.47,35.19 v1(5.88,35.19)
  Bottom Layer w0.254: v1(5.88,35.19) 7.82,37.12 17.78,37.12 v1(18.15,37.5) ; 38.1,39.11 36.45,37.46 25.78,37.46 v1(24.89,38.35)
PA14: length 35.3
  Top Layer w0.254: v1(3.81,35.18) 3.64,35.01 U1.37 ; v1(24.89,39.24) 18.77,39.24 v1(17.6,38.07)
  Bottom Layer w0.254: v1(3.81,35.18) 6.11,37.48 17.01,37.48 v1(17.6,38.07) ; 35.56,39.11 35.18,38.73 25.4,38.73 v1(24.89,39.24)
PA15: length 44.8
  Top Layer w0.254: v1(5.54,33.6) 5.19,33.6 4.25,34.54 2.39,34.54 U1.38
  Bottom Layer w0.254: U5.15 25.69,3.38 23.75,5.33 23.75,7.89 14.73,16.91 14.73,26.23 13.08,27.88 v1(13.08,29.46) 12.58,29.97 9.4,29.97 6.8,32.57 6.14,32.57 5.54,33.17 v1(5.54,33.6)
PB2: length 53
  Top Layer w0.254: U1.20 10.13,33.01 8.57,34.57 8.14,34.57 7.86,34.29 v1(7.86,34.21)
  Top Layer w0.508: R17.2 43.16,19.04 v1(43.37,19.24)
  Bottom Layer w0.254: v1(43.37,19.24) 43.37,16.87 41.42,14.92 40.26,14.92 37.89,17.3 34.65,17.3 29.74,22.2 28.15,22.2 23.88,26.47 21.09,26.47 18.15,29.41 15.48,29.41 14.21,30.68 9.7,30.68 8.09,32.28 8.09,33.98 v1(7.86,34.21)
PB8: length 53.2
  Top Layer w0.254: U1.45 3.07,31.01 3.38,31.32 3.38,31.52 3.71,31.85 4.13,31.85 4.41,32.13 4.41,32.58 v1(4.89,33.07)
  Bottom Layer w0.254: 32.77,2.28 31.67,3.38 U5.7 ; 32.77,2.28 32,2.28 31.75,2.03 25.65,2.03 23.39,4.29 23.39,7.74 14.28,16.86 14.28,21.66 12.42,23.52 12.42,26.45 6.65,32.21 6,32.21 5.14,33.07 v1(4.89,33.07) ; 32.77,2.28 v1(32.89,2.28)
PB12: length 46.1
  Top Layer w0.254: v1(13.21,38.67) 10.98,38.67 9.35,37.04 U1.25 ; v1(16.97,38.67) 17.02,38.62 17.02,29.06 v1(16.33,28.37)
  Bottom Layer w0.254: v1(13.21,38.67) v1(16.97,38.67) ; 26.05,5.97 25.65,5.97 25.2,6.42 25.2,8.46 16.68,16.97 16.68,26.37 16.66,26.39 16.66,28.04 v1(16.33,28.37)
PB13: length 49.3
  Top Layer w0.254: U1.26 8.85,37.21 10.9,39.25 v1(12.57,39.25) ; v1(15.06,27.93) 16.64,29.5 16.64,33.27 16.38,33.53 16.38,39.25 v1(16.41,39.28)
  Bottom Layer w0.254: v1(15.06,27.93) 15.88,27.11 15.88,16.77 24.49,8.16 24.49,5.86 25.65,4.7 26.04,4.7 U5.17 ; v1(16.41,39.28) 16.39,39.26 15.46,39.26 15.44,39.28 12.6,39.28 v1(12.57,39.25)
PB14: length 50.2
  Top Layer w0.254: v1(12.06,39.88) 10.79,39.88 8.35,37.44 U1.27 ; 15.7,39.81 15.7,33.7 16.21,33.19 16.21,29.67 15.11,28.57 14.68,28.57 v1(14.66,28.6)
  Bottom Layer w0.254: 15.7,39.81 12.84,39.81 12.81,39.84 12.33,39.84 12.31,39.81 12.13,39.81 v1(12.06,39.88) ; v1(14.66,28.6) 15.22,28.6 16.31,27.51 16.31,16.84 24.84,8.31 24.84,6.15 25.66,5.33 U5.18
  vias: v1(15.7,39.84)
PB15: length 53.3
  Top Layer w0.254: v1(11.56,40.51) 10.79,40.51 7.85,37.57 U1.28 ; v1(13.89,29.46) 15.48,29.46 15.85,29.83 15.85,33.04 15.11,33.78 v1(15.11,40.47)
  Bottom Layer w0.254: v1(15.11,40.47) 12.32,40.47 12.31,40.46 11.82,40.46 11.79,40.43 11.64,40.43 v1(11.56,40.51) ; v1(13.89,29.46) 13.89,27.95 15.29,26.55 15.29,16.85 24.13,8.01 24.13,5.59 25.68,4.03 U5.16
PC13: length 38.1
  Top Layer w0.254: U1.2 4.35,29.4 6.46,31.51 7.37,31.51 10.05,28.83 11.09,28.83 v1(11.64,28.28) ; v1(20.35,35.4) 20,35.05 19.3,35.05 17.4,33.15 17.4,28.57 15.02,26.2 v1(13.72,26.2) ; R36.1 v1(20.1,42.42)
  Bottom Layer w0.254: v1(20.1,42.42) 20.35,42.16 v1(20.35,35.4) ; v1(11.64,28.28) v1(13.72,26.2)
PC14: length 40.1
  Top Layer w0.254: U1.3 4.85,28.86 6.62,30.62 v1(6.67,30.62)
  Bottom Layer w0.254: v1(6.67,30.62) 7.75,30.62 12.06,26.3 12.06,24.99 8.76,21.69 8.76,20.98 arc(8.73,20.74) 8.72,20.5 arc(8.73,20.26) 8.76,20.02 8.76,19.18 10.41,17.52 12.7,17.52 19.78,10.44 v1(19.78,8.29) 19.87,8.38 21.84,8.38 22.64,7.58 U4.5
PC15: length 37.4
  Top Layer w0.254: v1(7.27,30.02) 6.67,30.02 5.69,29.04 5.68,29.04 5.44,28.79 5.44,28.79 5.35,28.7 U1.4
  Bottom Layer w0.254: U4.7 19.87,6.55 v1(19.74,6.68) 19.74,7.51 19.2,8.05 19.2,10.48 12.51,17.17 10.27,17.17 8.36,19.08 8.36,21.79 11.68,25.12 11.68,26.18 7.84,30.02 v1(7.27,30.02)
XI: length 12.5
  Top Layer w0.254: X2.1 29.86,57.52 29.03,56.68 29.03,54.99 29.66,54.35 R8.1 ; v1(25.27,51.43) 24.24,50.4 U3.10 ; v1(28.7,51.43) 29.91,52.64
  Top Layer w0.508: C20.1 29.91,54.16 R8.1
  Bottom Layer w0.254: v1(25.27,51.43) v1(28.7,51.43)
XO: length 9.3
  Top Layer w0.254: C21.2 28,51.75 27.1,50.85 25.45,50.85 24.5,49.9 U3.9
  Top Layer w0.508: C21.2 28.2,52.9 R8.2 28.2,55.82 X2.3
$1N28: length 10.8
  Top Layer w0.254: U1.44 2.34,31.49 1.67,31.49 1.15,32.02 v1(1.12,32.02)
  Bottom Layer w0.254: v1(1.12,32.02) 2.54,33.44 v1(2.54,40.77)
$1N68: length 2
  Top Layer w0.508: 8.39,14.61 10.16,14.61 10.3,14.48
$1N70: length 2.5
  Top Layer w0.254: R29.1 10.69,49.14 8.39,49.14
$1N71: length 1.9
  Top Layer w0.508: 40.9,48.14 41.15,47.9 R28.1
$1N72: length 2.6
  Top Layer w0.508: 37.71,14.73 39.73,14.73 40.12,15.12
$1N90: length 1.6
  Top Layer w0.508: R30.2 6.83,45.33 Q6.3
$1N91: length 1.4
  Top Layer w0.508: R32.1 3.88,45.33 Q6.1
$2N9: length 1.8
  Top Layer w0.254: U2.20 21.59,32.74 20.81,33.53 C8.1
$2N13: length 1.7
  Top Layer w0.254: U2.10 27.22,32.24 C11.2
$2N14: length 1.7
  Top Layer w0.254: R6.2 27.19,31.74 U2.9
$3N27: length 5.9
  Top Layer w0.254: 20.64,54.48 L2.2 ; 20.64,54.48 20.64,54.29 21.95,52.98 U3.13 ; 20.64,54.48 20.32,54.48 19.05,53.21 19.05,53.15
$3N28: length 1.7
  Top Layer w0.254: C15.1 18.92,56.07 L1.2
$3N29: length 5.1
  Top Layer w0.254: U3.12 22.45,54.19 L2.1 23.69,54.61 L3.2
$3N30: length 8.1
  Top Layer w0.254: 23.75,52.89 23.75,52.19 U3.11 ; 23.43,52.89 23.5,52.89 ; L3.1 24.06,53.15 24.89,53.97 24.89,55.75 24.45,56.19 C17.2
  Top Layer w0.508: C18.2 C17.2
$3N35: length 1.6
  Top Layer w0.254: R7.1 19.02,51.05 19.68,50.4 U3.16
$3N37: length 1.6
  Top Layer w0.254: C19.1 18.88,48.26 19.52,48.9 19.95,48.9
$3N46: length 36.5
  Top Layer w0.254: 16.01,49.03 16.01,51.7 16.38,52.07 20.83,52.07 20.95,51.95 U3.15 ; 16.01,49.03 16.38,49.4 U3.18 ; 16.01,49.03 16,49.02 16,47.12 18.92,44.19 23.37,44.19 24.76,45.59 24.76,46.48 25.72,47.43 ; 23.95,48.9 24.44,48.9 C41.2
  Top Layer w0.508: Q7.3 26.67,46.67 27.43,47.43
  Top Layer w0.762: C41.2 C40.2 C13.2 C14.2
$3N50: length 3.9
  Top Layer w0.254: Q7.1 25.77,43.96 R35.1 R36.2
$5N18: length 23
  Top Layer w0.254: LED8.2 LED7.1 44.56,31.49 R16.2
  Bottom Layer w0.254: v1(27.17,25.78) 27.69,25.78 33.27,31.37 v1(38.74,31.37)
$5N19: length 21.7
  Top Layer w0.254: LED6.2 LED5.1 40.16,32.23 39.24,33.15 R15.2
  Bottom Layer w0.254: v1(40.94,32.26) 39.41,30.73 33.4,30.73 27.18,24.51 v1(27.17,24.51)
$5N20: length 23
  Top Layer w0.254: LED8.1 LED7.2 LED6.1 LED5.2
  Bottom Layer w0.254: v1(27.17,27.05) 28.19,27.05 33.26,32.12 39.74,32.12 v1(40.96,33.34)
$5N26: length 2.5
  Top Layer w0.508: L5.1 20.21,24.02 20.7,24.51 U6.7
$5N28: length 27.4
  Bottom Layer w0.254: v1(41.91,17.53) 41.78,17.41 41.78,16.17 41.49,15.88 41.49,15.62 41.15,15.28 40.66,15.28 40.53,15.41 40.31,15.41 40.13,15.59 40.13,15.66 38.01,17.78 37.07,17.78 arc(36.5,17.72) 35.93,17.78 34.67,17.78 29.89,22.55 28.29,22.55 23.67,27.18 21.46,27.18 v1(21.34,27.05)
$5N39: length 1.5
  Top Layer w0.254: R13.2 23.26,11.71 U7.3
$5N42: length 1.5
  Top Layer w0.508: R3.2 30.68,24.76 C39.2
$6N2: length 3.5
  Top Layer w0.508: Q2.3 10.41,50.69 7.05,50.69
$6N6: length 3
  Top Layer w0.508: Q2.1 11.49,54.03 R19.2 R18.2
$6N9: length 3
  Top Layer w0.508: Q3.1 11.42,11.23 R21.2 R20.2
$6N11: length 6.9
  Top Layer w0.508: 6.27,14.05 5.33,13.12 5.33,12.06 5.84,11.56 6.98,11.56 7.62,12.19 Q3.3
$6N14: length 3.1
  Top Layer w0.508: R22.2 R23.2 37.35,52.52 Q4.1
$6N16: length 6.6
  Top Layer w0.508: 42.5,49.7 43.24,50.43 43.24,51.38 42.29,52.32 41.66,52.32 40.89,51.56 Q4.3
$6N19: length 3
  Top Layer w0.508: R24.2 R25.2 37.22,10.99 Q5.1
$6N21: length 3.5
  Top Layer w0.508: 41.47,13.32 41.34,13.19 Q5.3
$7N7: length 3.3
  Top Layer w0.254: 32.96,5.07 32.9,5.07 v1(32.89,5.08)
  Top Layer w0.508: v1(32.89,5.08) 32.89,3.74 C26.2
  Bottom Layer w0.355: 31.22,5.33 32.64,5.33 v1(32.89,5.08)
$7N9: length 9
  Top Layer w0.508: C35.1 32,8.64 v1(30.48,7.11) ; 30.35,9.28 30.35,9.4 32,9.4 ; 30.35,9.28 30.48,9.15 ; 30.35,9.28 R14.2
  Bottom Layer w0.355: v1(30.48,7.11) 30.96,6.63 U5.2

## Copper pours and planes (outline as drawn; the poured copper is in the pictures)
GND on Top Layer: -14.86,68.32 63.37,68.32 63.37,-1.4 -14.86,-1.4
GND on Top Layer: 18.09,64.89 18.99,64.89 18.99,59.59 18.09,59.59
GND on Bottom Layer: -3.43,78.36 51.05,78.36 51.05,-14.48 -3.43,-14.48
AT1 on Top Layer: 21.79,64.87 22.29,64.87 22.29,62.05 21.79,62.05
AT1 on Top Layer: 25.89,64.87 26.39,64.87 26.39,62.05 25.89,62.05
AT1 on Top Layer: 21.88,62.54 24.42,62.54 24.42,62.05 21.88,62.05
AT1 on Top Layer: 28.09,65.19 30.39,65.19 30.39,64.69 28.09,64.69
AT1 on Top Layer: 23.99,64.87 24.49,64.87 24.49,62.05 23.99,62.05
AT1 on Top Layer: 29.89,64.87 30.39,64.87 30.39,60.75 29.89,60.75
AT1 on Top Layer: 23.99,65.19 26.39,65.19 26.39,64.69 23.99,64.69
AT1 on Top Layer: 28.09,64.87 28.59,64.87 28.59,62.05 28.09,62.05
AT1 on Top Layer: 19.79,64.92 20.29,64.92 20.29,59.59 19.79,59.59
AT1 on Top Layer: 18.09,65.19 22.29,65.19 22.29,64.69 18.09,64.69
AT1 on Top Layer: 25.9,62.55 28.39,62.55 28.39,62.05 25.9,62.05

Small or netless copper shapes (teardrops, artwork), in the pictures only: 411 on Top Layer, 122 on Bottom Layer

## Text on the board
Bottom Silkscreen Layer: Samir's MoonLab
Top Silkscreen Layer: GND | SW / CLK | RX | VCC | SW / DIO | TX
